# Altium schematic sheet MONO65_A2_s04 [Switches-1].SchDoc
size A3; DocumentNumber: 4; SheetNumber: 4; SheetTotal: 7
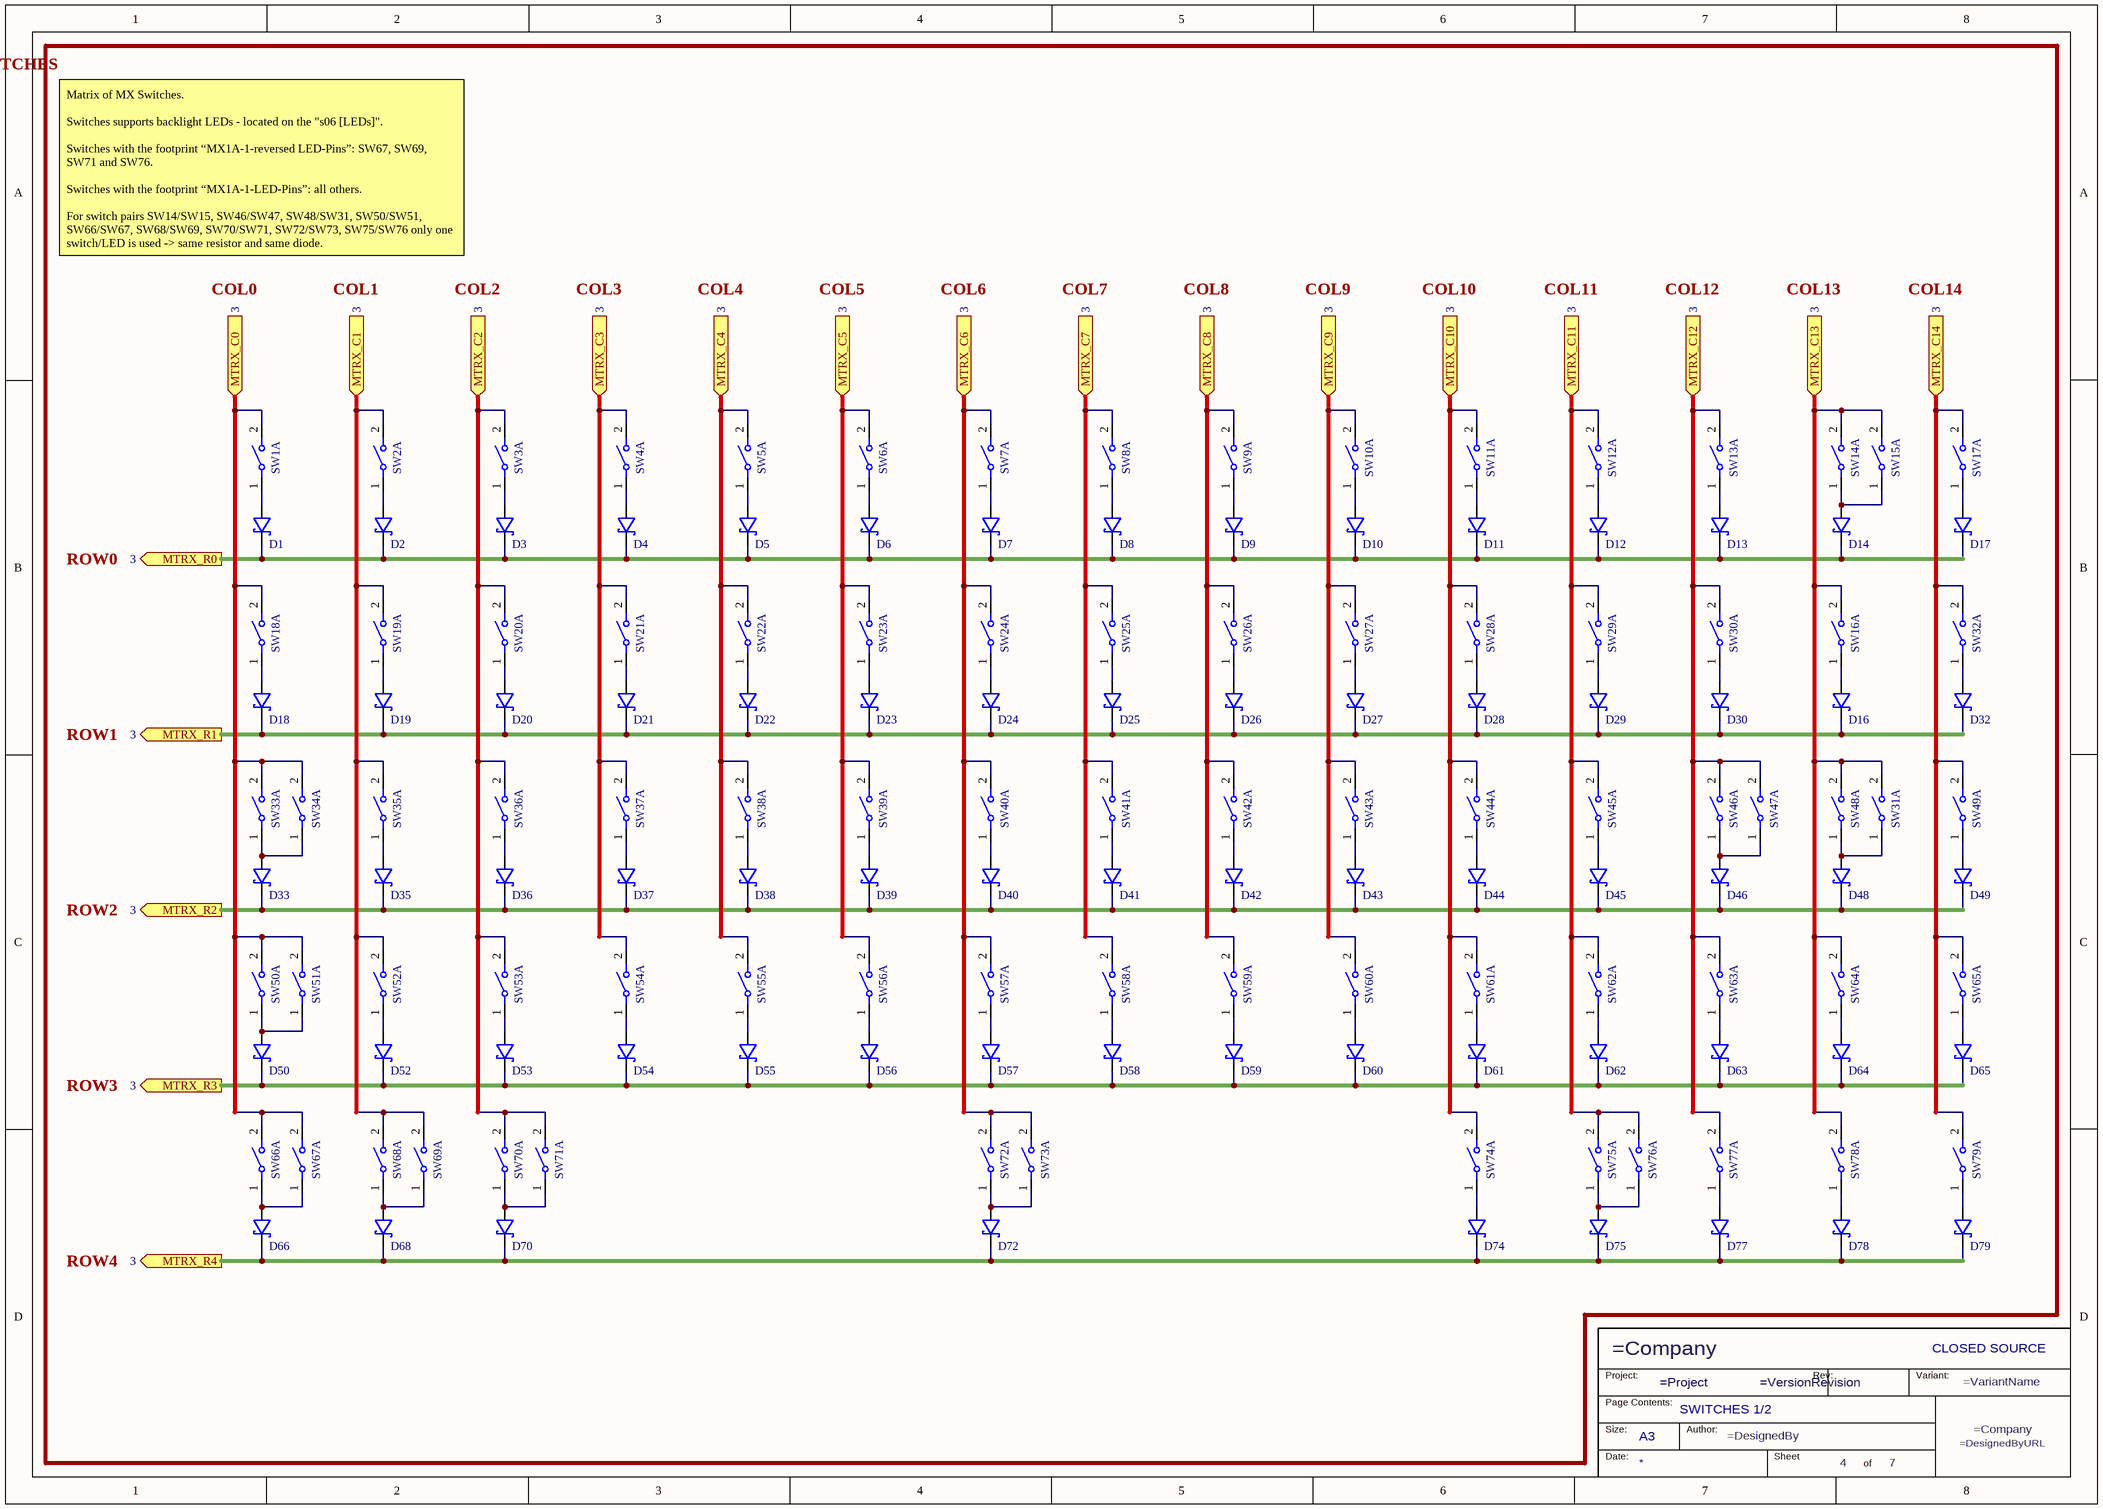
[diagram p0: MONO65_A2_s04 [Switches-1].SchDoc]

## Parts
D1  SD0805S040S0R5  [DIOC2012X06N - signal]  (value not drawn)
D2  SD0805S040S0R5  [DIOC2012X06N - signal]  (value not drawn)
D3  SD0805S040S0R5  [DIOC2012X06N - signal]  (value not drawn)
D4  SD0805S040S0R5  [DIOC2012X06N - signal]  (value not drawn)
D5  SD0805S040S0R5  [DIOC2012X06N - signal]  (value not drawn)
D6  SD0805S040S0R5  [DIOC2012X06N - signal]  (value not drawn)
D7  SD0805S040S0R5  [DIOC2012X06N - signal]  (value not drawn)
D8  SD0805S040S0R5  [DIOC2012X06N - signal]  (value not drawn)
D9  SD0805S040S0R5  [DIOC2012X06N - signal]  (value not drawn)
D10  SD0805S040S0R5  [DIOC2012X06N - signal]  (value not drawn)
D11  SD0805S040S0R5  [DIOC2012X06N - signal]  (value not drawn)
D12  SD0805S040S0R5  [DIOC2012X06N - signal]  (value not drawn)
D13  SD0805S040S0R5  [DIOC2012X06N - signal]  (value not drawn)
D14  SD0805S040S0R5  [DIOC2012X06N - signal]  (value not drawn)
D16  SD0805S040S0R5  [DIOC2012X06N - signal]  (value not drawn)
D17  SD0805S040S0R5  [DIOC2012X06N - signal]  (value not drawn)
D18  SD0805S040S0R5  [DIOC2012X06N - signal]  (value not drawn)
D19  SD0805S040S0R5  [DIOC2012X06N - signal]  (value not drawn)
D20  SD0805S040S0R5  [DIOC2012X06N - signal]  (value not drawn)
D21  SD0805S040S0R5  [DIOC2012X06N - signal]  (value not drawn)
D22  SD0805S040S0R5  [DIOC2012X06N - signal]  (value not drawn)
D23  SD0805S040S0R5  [DIOC2012X06N - signal]  (value not drawn)
D24  SD0805S040S0R5  [DIOC2012X06N - signal]  (value not drawn)
D25  SD0805S040S0R5  [DIOC2012X06N - signal]  (value not drawn)
D26  SD0805S040S0R5  [DIOC2012X06N - signal]  (value not drawn)
D27  SD0805S040S0R5  [DIOC2012X06N - signal]  (value not drawn)
D28  SD0805S040S0R5  [DIOC2012X06N - signal]  (value not drawn)
D29  SD0805S040S0R5  [DIOC2012X06N - signal]  (value not drawn)
D30  SD0805S040S0R5  [DIOC2012X06N - signal]  (value not drawn)
D32  SD0805S040S0R5  [DIOC2012X06N - signal]  (value not drawn)
D33  SD0805S040S0R5  [DIOC2012X06N - signal]  (value not drawn)
D35  SD0805S040S0R5  [DIOC2012X06N - signal]  (value not drawn)
D36  SD0805S040S0R5  [DIOC2012X06N - signal]  (value not drawn)
D37  SD0805S040S0R5  [DIOC2012X06N - signal]  (value not drawn)
D38  SD0805S040S0R5  [DIOC2012X06N - signal]  (value not drawn)
D39  SD0805S040S0R5  [DIOC2012X06N - signal]  (value not drawn)
D40  SD0805S040S0R5  [DIOC2012X06N - signal]  (value not drawn)
D41  SD0805S040S0R5  [DIOC2012X06N - signal]  (value not drawn)
D42  SD0805S040S0R5  [DIOC2012X06N - signal]  (value not drawn)
D43  SD0805S040S0R5  [DIOC2012X06N - signal]  (value not drawn)
D44  SD0805S040S0R5  [DIOC2012X06N - signal]  (value not drawn)
D45  SD0805S040S0R5  [DIOC2012X06N - signal]  (value not drawn)
D46  SD0805S040S0R5  [DIOC2012X06N - signal]  (value not drawn)
D48  SD0805S040S0R5  [DIOC2012X06N - signal]  (value not drawn)
D49  SD0805S040S0R5  [DIOC2012X06N - signal]  (value not drawn)
D50  SD0805S040S0R5  [DIOC2012X06N - signal]  (value not drawn)
D52  SD0805S040S0R5  [DIOC2012X06N - signal]  (value not drawn)
D53  SD0805S040S0R5  [DIOC2012X06N - signal]  (value not drawn)
D54  SD0805S040S0R5  [DIOC2012X06N - signal]  (value not drawn)
D55  SD0805S040S0R5  [DIOC2012X06N - signal]  (value not drawn)
D56  SD0805S040S0R5  [DIOC2012X06N - signal]  (value not drawn)
D57  SD0805S040S0R5  [DIOC2012X06N - signal]  (value not drawn)
D58  SD0805S040S0R5  [DIOC2012X06N - signal]  (value not drawn)
D59  SD0805S040S0R5  [DIOC2012X06N - signal]  (value not drawn)
D60  SD0805S040S0R5  [DIOC2012X06N - signal]  (value not drawn)
D61  SD0805S040S0R5  [DIOC2012X06N - signal]  (value not drawn)
D62  SD0805S040S0R5  [DIOC2012X06N - signal]  (value not drawn)
D63  SD0805S040S0R5  [DIOC2012X06N - signal]  (value not drawn)
D64  SD0805S040S0R5  [DIOC2012X06N - signal]  (value not drawn)
D65  SD0805S040S0R5  [DIOC2012X06N - signal]  (value not drawn)
D66  SD0805S040S0R5  [DIOC2012X06N - signal]  (value not drawn)
D68  SD0805S040S0R5  [DIOC2012X06N - signal]  (value not drawn)
D70  SD0805S040S0R5  [DIOC2012X06N - signal]  (value not drawn)
D72  SD0805S040S0R5  [DIOC2012X06N - signal]  (value not drawn)
D74  SD0805S040S0R5  [DIOC2012X06N - signal]  (value not drawn)
D75  SD0805S040S0R5  [DIOC2012X06N - signal]  (value not drawn)
D77  SD0805S040S0R5  [DIOC2012X06N - signal]  (value not drawn)
D78  SD0805S040S0R5  [DIOC2012X06N - signal]  (value not drawn)
D79  SD0805S040S0R5  [DIOC2012X06N - signal]  (value not drawn)
SW1  MX1A-11GW  [MX1A-1-LED-Pins]  (value not drawn)  (part A of 2)
SW2  MX1A-11GW  [MX1A-1-LED-Pins]  (value not drawn)  (part A of 2)
SW3  MX1A-11GW  [MX1A-1-LED-Pins]  (value not drawn)  (part A of 2)
SW4  MX1A-11GW  [MX1A-1-LED-Pins]  (value not drawn)  (part A of 2)
SW5  MX1A-11GW  [MX1A-1-LED-Pins]  (value not drawn)  (part A of 2)
SW6  MX1A-11GW  [MX1A-1-LED-Pins]  (value not drawn)  (part A of 2)
SW7  MX1A-11GW  [MX1A-1-LED-Pins]  (value not drawn)  (part A of 2)
SW8  MX1A-11GW  [MX1A-1-LED-Pins]  (value not drawn)  (part A of 2)
SW9  MX1A-11GW  [MX1A-1-LED-Pins]  (value not drawn)  (part A of 2)
SW10  MX1A-11GW  [MX1A-1-LED-Pins]  (value not drawn)  (part A of 2)
SW11  MX1A-11GW  [MX1A-1-LED-Pins]  (value not drawn)  (part A of 2)
SW12  MX1A-11GW  [MX1A-1-LED-Pins]  (value not drawn)  (part A of 2)
SW13  MX1A-11GW  [MX1A-1-LED-Pins]  (value not drawn)  (part A of 2)
SW14  MX1A-11GW  [MX1A-1-LED-Pins]  (value not drawn)  (part A of 2)
SW15  MX1A-11GW  [MX1A-1-LED-Pins]  (value not drawn)  (part A of 2)
SW16  MX1A-11GW  [MX1A-1-LED-Pins]  (value not drawn)  (part A of 2)
SW17  MX1A-11GW  [MX1A-1-LED-Pins]  (value not drawn)  (part A of 2)
SW18  MX1A-11GW  [MX1A-1-LED-Pins]  (value not drawn)  (part A of 2)
SW19  MX1A-11GW  [MX1A-1-LED-Pins]  (value not drawn)  (part A of 2)
SW20  MX1A-11GW  [MX1A-1-LED-Pins]  (value not drawn)  (part A of 2)
SW21  MX1A-11GW  [MX1A-1-LED-Pins]  (value not drawn)  (part A of 2)
SW22  MX1A-11GW  [MX1A-1-LED-Pins]  (value not drawn)  (part A of 2)
SW23  MX1A-11GW  [MX1A-1-LED-Pins]  (value not drawn)  (part A of 2)
SW24  MX1A-11GW  [MX1A-1-LED-Pins]  (value not drawn)  (part A of 2)
SW25  MX1A-11GW  [MX1A-1-LED-Pins]  (value not drawn)  (part A of 2)
SW26  MX1A-11GW  [MX1A-1-LED-Pins]  (value not drawn)  (part A of 2)
SW27  MX1A-11GW  [MX1A-1-LED-Pins]  (value not drawn)  (part A of 2)
SW28  MX1A-11GW  [MX1A-1-LED-Pins]  (value not drawn)  (part A of 2)
SW29  MX1A-11GW  [MX1A-1-LED-Pins]  (value not drawn)  (part A of 2)
SW30  MX1A-11GW  [MX1A-1-LED-Pins]  (value not drawn)  (part A of 2)
SW31  MX1A-11GW  [MX1A-1-LED-Pins]  (value not drawn)  (part A of 2)
SW32  MX1A-11GW  [MX1A-1-LED-Pins]  (value not drawn)  (part A of 2)
SW33  MX1A-11GW  [MX1A-1-LED-Pins]  (value not drawn)  (part A of 2)
SW34  MX1A-11GW  [MX1A-1-LED-Pins]  (value not drawn)  (part A of 2)
SW35  MX1A-11GW  [MX1A-1-LED-Pins]  (value not drawn)  (part A of 2)
SW36  MX1A-11GW  [MX1A-1-LED-Pins]  (value not drawn)  (part A of 2)
SW37  MX1A-11GW  [MX1A-1-LED-Pins]  (value not drawn)  (part A of 2)
SW38  MX1A-11GW  [MX1A-1-LED-Pins]  (value not drawn)  (part A of 2)
SW39  MX1A-11GW  [MX1A-1-LED-Pins]  (value not drawn)  (part A of 2)
SW40  MX1A-11GW  [MX1A-1-LED-Pins]  (value not drawn)  (part A of 2)
SW41  MX1A-11GW  [MX1A-1-LED-Pins]  (value not drawn)  (part A of 2)
SW42  MX1A-11GW  [MX1A-1-LED-Pins]  (value not drawn)  (part A of 2)
SW43  MX1A-11GW  [MX1A-1-LED-Pins]  (value not drawn)  (part A of 2)
SW44  MX1A-11GW  [MX1A-1-LED-Pins]  (value not drawn)  (part A of 2)
SW45  MX1A-11GW  [MX1A-1-LED-Pins]  (value not drawn)  (part A of 2)
SW46  MX1A-11GW  [MX1A-1-LED-Pins]  (value not drawn)  (part A of 2)
SW47  MX1A-11GW  [MX1A-1-LED-Pins]  (value not drawn)  (part A of 2)
SW48  MX1A-11GW  [MX1A-1-LED-Pins]  (value not drawn)  (part A of 2)
SW49  MX1A-11GW  [MX1A-1-LED-Pins]  (value not drawn)  (part A of 2)
SW50  MX1A-11GW  [MX1A-1-LED-Pins]  (value not drawn)  (part A of 2)
SW51  MX1A-11GW  [MX1A-1-LED-Pins]  (value not drawn)  (part A of 2)
SW52  MX1A-11GW  [MX1A-1-LED-Pins]  (value not drawn)  (part A of 2)
SW53  MX1A-11GW  [MX1A-1-LED-Pins]  (value not drawn)  (part A of 2)
SW54  MX1A-11GW  [MX1A-1-LED-Pins]  (value not drawn)  (part A of 2)
SW55  MX1A-11GW  [MX1A-1-LED-Pins]  (value not drawn)  (part A of 2)
SW56  MX1A-11GW  [MX1A-1-LED-Pins]  (value not drawn)  (part A of 2)
SW57  MX1A-11GW  [MX1A-1-LED-Pins]  (value not drawn)  (part A of 2)
SW58  MX1A-11GW  [MX1A-1-LED-Pins]  (value not drawn)  (part A of 2)
SW59  MX1A-11GW  [MX1A-1-LED-Pins]  (value not drawn)  (part A of 2)
SW60  MX1A-11GW  [MX1A-1-LED-Pins]  (value not drawn)  (part A of 2)
SW61  MX1A-11GW  [MX1A-1-LED-Pins]  (value not drawn)  (part A of 2)
SW62  MX1A-11GW  [MX1A-1-LED-Pins]  (value not drawn)  (part A of 2)
SW63  MX1A-11GW  [MX1A-1-LED-Pins]  (value not drawn)  (part A of 2)
SW64  MX1A-11GW  [MX1A-1-LED-Pins]  (value not drawn)  (part A of 2)
SW65  MX1A-11GW  [MX1A-1-LED-Pins]  (value not drawn)  (part A of 2)
SW66  MX1A-11GW  [MX1A-1-LED-Pins]  (value not drawn)  (part A of 2)
SW67  MX1A-11GW  [MX1A-1-reversed LED-Pins]  (value not drawn)  (part A of 2)
SW68  MX1A-11GW  [MX1A-1-LED-Pins]  (value not drawn)  (part A of 2)
SW69  MX1A-11GW  [MX1A-1-reversed LED-Pins]  (value not drawn)  (part A of 2)
SW70  MX1A-11GW  [MX1A-1-LED-Pins]  (value not drawn)  (part A of 2)
SW71  MX1A-11GW  [MX1A-1-reversed LED-Pins]  (value not drawn)  (part A of 2)
SW72  MX1A-11GW  [MX1A-1-LED-Pins]  (value not drawn)  (part A of 2)
SW73  MX1A-11GW  [MX1A-1-LED-Pins]  (value not drawn)  (part A of 2)
SW74  MX1A-11GW  [MX1A-1-LED-Pins]  (value not drawn)  (part A of 2)
SW75  MX1A-11GW  [MX1A-1-LED-Pins]  (value not drawn)  (part A of 2)
SW76  MX1A-11GW  [MX1A-1-reversed LED-Pins]  (value not drawn)  (part A of 2)
SW77  MX1A-11GW  [MX1A-1-LED-Pins]  (value not drawn)  (part A of 2)
SW78  MX1A-11GW  [MX1A-1-LED-Pins]  (value not drawn)  (part A of 2)
SW79  MX1A-11GW  [MX1A-1-LED-Pins]  (value not drawn)  (part A of 2)
TB*?  PageContents: SWITCHES 1/2  Licence: CLOSED SOURCE  Size: A3  (hidden comment: TBL TitleBlock 01)  (graphical)

## Ports
MTRX_C0 (in, see 3), MTRX_C1 (in, see 3), MTRX_C2 (in, see 3), MTRX_C3 (in, see 3), MTRX_C4 (in, see 3), MTRX_C5 (in, see 3), MTRX_C6 (in, see 3), MTRX_C7 (in, see 3), MTRX_C8 (in, see 3), MTRX_C9 (in, see 3), MTRX_C10 (in, see 3), MTRX_C11 (in, see 3), MTRX_C12 (in, see 3), MTRX_C13 (in, see 3), MTRX_C14 (in, see 3), MTRX_R0 (out, see 3), MTRX_R1 (out, see 3), MTRX_R2 (out, see 3), MTRX_R3 (out, see 3), MTRX_R4 (out, see 3)

## Nets
MTRX_C0: SW1.2(N.O.) SW18.2(N.O.) SW33.2(N.O.) SW34.2(N.O.) SW50.2(N.O.) SW51.2(N.O.) SW66.2(N.O.) SW67.2(N.O.) ; port MTRX_C0
MTRX_C1: SW2.2(N.O.) SW19.2(N.O.) SW35.2(N.O.) SW52.2(N.O.) SW68.2(N.O.) SW69.2(N.O.) ; port MTRX_C1
MTRX_C2: SW3.2(N.O.) SW20.2(N.O.) SW36.2(N.O.) SW53.2(N.O.) SW70.2(N.O.) SW71.2(N.O.) ; port MTRX_C2
MTRX_C3: SW4.2(N.O.) SW21.2(N.O.) SW37.2(N.O.) SW54.2(N.O.) ; port MTRX_C3
MTRX_C4: SW5.2(N.O.) SW22.2(N.O.) SW38.2(N.O.) SW55.2(N.O.) ; port MTRX_C4
MTRX_C5: SW6.2(N.O.) SW23.2(N.O.) SW39.2(N.O.) SW56.2(N.O.) ; port MTRX_C5
MTRX_C6: SW7.2(N.O.) SW24.2(N.O.) SW40.2(N.O.) SW57.2(N.O.) SW72.2(N.O.) SW73.2(N.O.) ; port MTRX_C6
MTRX_C7: SW8.2(N.O.) SW25.2(N.O.) SW41.2(N.O.) SW58.2(N.O.) ; port MTRX_C7
MTRX_C8: SW9.2(N.O.) SW26.2(N.O.) SW42.2(N.O.) SW59.2(N.O.) ; port MTRX_C8
MTRX_C9: SW10.2(N.O.) SW27.2(N.O.) SW43.2(N.O.) SW60.2(N.O.) ; port MTRX_C9
MTRX_C10: SW11.2(N.O.) SW28.2(N.O.) SW44.2(N.O.) SW61.2(N.O.) SW74.2(N.O.) ; port MTRX_C10
MTRX_C11: SW12.2(N.O.) SW29.2(N.O.) SW45.2(N.O.) SW62.2(N.O.) SW75.2(N.O.) SW76.2(N.O.) ; port MTRX_C11
MTRX_C12: SW13.2(N.O.) SW30.2(N.O.) SW46.2(N.O.) SW47.2(N.O.) SW63.2(N.O.) SW77.2(N.O.) ; port MTRX_C12
MTRX_C13: SW14.2(N.O.) SW15.2(N.O.) SW16.2(N.O.) SW31.2(N.O.) SW48.2(N.O.) SW64.2(N.O.) SW78.2(N.O.) ; port MTRX_C13
MTRX_C14: SW17.2(N.O.) SW32.2(N.O.) SW49.2(N.O.) SW65.2(N.O.) SW79.2(N.O.) ; port MTRX_C14
MTRX_R0: D1.1(K) D2.1(K) D3.1(K) D4.1(K) D5.1(K) D6.1(K) D7.1(K) D8.1(K) D9.1(K) D10.1(K) D11.1(K) D12.1(K) D13.1(K) D14.1(K) D17.1(K) ; port MTRX_R0
MTRX_R1: D16.1(K) D18.1(K) D19.1(K) D20.1(K) D21.1(K) D22.1(K) D23.1(K) D24.1(K) D25.1(K) D26.1(K) D27.1(K) D28.1(K) D29.1(K) D30.1(K) D32.1(K) ; port MTRX_R1
MTRX_R2: D33.1(K) D35.1(K) D36.1(K) D37.1(K) D38.1(K) D39.1(K) D40.1(K) D41.1(K) D42.1(K) D43.1(K) D44.1(K) D45.1(K) D46.1(K) D48.1(K) D49.1(K) ; port MTRX_R2
MTRX_R3: D50.1(K) D52.1(K) D53.1(K) D54.1(K) D55.1(K) D56.1(K) D57.1(K) D58.1(K) D59.1(K) D60.1(K) D61.1(K) D62.1(K) D63.1(K) D64.1(K) D65.1(K) ; port MTRX_R3
MTRX_R4: D66.1(K) D68.1(K) D70.1(K) D72.1(K) D74.1(K) D75.1(K) D77.1(K) D78.1(K) D79.1(K) ; port MTRX_R4
NetD1_2: D1.2(A) SW1.1(COM)
NetD2_2: D2.2(A) SW2.1(COM)
NetD3_2: D3.2(A) SW3.1(COM)
NetD4_2: D4.2(A) SW4.1(COM)
NetD5_2: D5.2(A) SW5.1(COM)
NetD6_2: D6.2(A) SW6.1(COM)
NetD7_2: D7.2(A) SW7.1(COM)
NetD8_2: D8.2(A) SW8.1(COM)
NetD9_2: D9.2(A) SW9.1(COM)
NetD10_2: D10.2(A) SW10.1(COM)
NetD11_2: D11.2(A) SW11.1(COM)
NetD12_2: D12.2(A) SW12.1(COM)
NetD13_2: D13.2(A) SW13.1(COM)
NetD14_2: D14.2(A) SW14.1(COM) SW15.1(COM)
NetD16_2: D16.2(A) SW16.1(COM)
NetD17_2: D17.2(A) SW17.1(COM)
NetD18_2: D18.2(A) SW18.1(COM)
NetD19_2: D19.2(A) SW19.1(COM)
NetD20_2: D20.2(A) SW20.1(COM)
NetD21_2: D21.2(A) SW21.1(COM)
NetD22_2: D22.2(A) SW22.1(COM)
NetD23_2: D23.2(A) SW23.1(COM)
NetD24_2: D24.2(A) SW24.1(COM)
NetD25_2: D25.2(A) SW25.1(COM)
NetD26_2: D26.2(A) SW26.1(COM)
NetD27_2: D27.2(A) SW27.1(COM)
NetD28_2: D28.2(A) SW28.1(COM)
NetD29_2: D29.2(A) SW29.1(COM)
NetD30_2: D30.2(A) SW30.1(COM)
NetD32_2: D32.2(A) SW32.1(COM)
NetD33_2: D33.2(A) SW33.1(COM) SW34.1(COM)
NetD35_2: D35.2(A) SW35.1(COM)
NetD36_2: D36.2(A) SW36.1(COM)
NetD37_2: D37.2(A) SW37.1(COM)
NetD38_2: D38.2(A) SW38.1(COM)
NetD39_2: D39.2(A) SW39.1(COM)
NetD40_2: D40.2(A) SW40.1(COM)
NetD41_2: D41.2(A) SW41.1(COM)
NetD42_2: D42.2(A) SW42.1(COM)
NetD43_2: D43.2(A) SW43.1(COM)
NetD44_2: D44.2(A) SW44.1(COM)
NetD45_2: D45.2(A) SW45.1(COM)
NetD46_2: D46.2(A) SW46.1(COM) SW47.1(COM)
NetD48_2: D48.2(A) SW31.1(COM) SW48.1(COM)
NetD49_2: D49.2(A) SW49.1(COM)
NetD50_2: D50.2(A) SW50.1(COM) SW51.1(COM)
NetD52_2: D52.2(A) SW52.1(COM)
NetD53_2: D53.2(A) SW53.1(COM)
NetD54_2: D54.2(A) SW54.1(COM)
NetD55_2: D55.2(A) SW55.1(COM)
NetD56_2: D56.2(A) SW56.1(COM)
NetD57_2: D57.2(A) SW57.1(COM)
NetD58_2: D58.2(A) SW58.1(COM)
NetD59_2: D59.2(A) SW59.1(COM)
NetD60_2: D60.2(A) SW60.1(COM)
NetD61_2: D61.2(A) SW61.1(COM)
NetD62_2: D62.2(A) SW62.1(COM)
NetD63_2: D63.2(A) SW63.1(COM)
NetD64_2: D64.2(A) SW64.1(COM)
NetD65_2: D65.2(A) SW65.1(COM)
NetD66_2: D66.2(A) SW66.1(COM) SW67.1(COM)
NetD68_2: D68.2(A) SW68.1(COM) SW69.1(COM)
NetD70_2: D70.2(A) SW70.1(COM) SW71.1(COM)
NetD72_2: D72.2(A) SW72.1(COM) SW73.1(COM)
NetD74_2: D74.2(A) SW74.1(COM)
NetD75_2: D75.2(A) SW75.1(COM) SW76.1(COM)
NetD77_2: D77.2(A) SW77.1(COM)
NetD78_2: D78.2(A) SW78.1(COM)
NetD79_2: D79.2(A) SW79.1(COM)

## Notes on the sheet
- MX SWITCHES
- Matrix of MX Switches.
  Switches supports backlight LEDs - located on the "s06 [LEDs]".
  Switches with the footprint “MX1A-1-reversed LED-Pins”: SW67, SW69, SW71 and SW76.
  Switches with the footprint “MX1A-1-LED-Pins”: all others.
  For switch pairs SW14/SW15, SW46/SW47, SW48/SW31, SW50/SW51, SW66/SW67, SW68/SW69, SW70/SW71, SW72/SW73, SW75/SW76 only one switch/LED is used -> same resistor and same diode.
- COL0
- COL1
- COL2
- COL3
- COL4
- COL5
- COL6
- COL7
- COL8
- COL9
- COL10
- COL11
- COL12
- COL13
- COL14
- ROW0
- ROW1
- ROW2
- ROW3
- ROW4
- (in symbol TBL TitleBlock 01) Project:; Rev:; Variant:; Page Contents:; Size:; Author:; Date:; Sheet; of

## Library data of the parts
D1-D14 D16-D30 D32 D33 D35-D46 D48-D50 D52-D66 D68 D70 D72 D74 D75 D77-D79 = SEM SCH 40V 0.5A 0805 SD0805S040S0R5: Schottky Diode, Small Signal, Single, 40 V, 500 mA, 480 mV, 5A max.; Manufacturer: Kyocera AVX; Forward Current: 500mA; Max Reverse Current: 100uA; Forward Voltage: 480mV; Max Repetitive Reverse Voltage (Vrrm): 40V; Supplier 1: Digi-Key; Manufacturer Part Number: SD0805S040S0R5; Stock 1: 50780; Pricing 1: 1 = 0,47000, 10 = 0,35600, 100 = 0,22150, 500 = 0,15158, 1000 = 0,11660 (USD); RoHS: Yes; Mount: Surface Mount; Number of Pins: 2; Case Code (Metric): 2012; Case Code (Imperial): 0805; Min Operating Temperature: -55°C; Max Operating Temperature: 125°C; Max Surge Current: 5A; Packaging: Tape and Reel; Package Quantity: 3000; Average Rectified Current: 500mA; Max Reverse Leakage Current: 100uA; Peak Non-Repetitive Surge Current: 5A; Max Forward Surge Current (Ifsm): 5A; Element Configuration: Single; Max Reverse Voltage (DC): 40V; Series: -; Radiation Hardening: No; REACH SVHC: No SVHC; RoHS Compliant: Yes; ComponentLink1URL: https://datasheet.ciiva.com/46411/1796790-46411381.pdf?src-supplier=Element14; ComponentLink1Description: https://datasheet.ciiva.com/46411/1796790-46411381.pdf?src-supplier=Element14; ComponentLink2URL: https://datasheet.ciiva.com/6377/schottky-6377002.pdf?src-supplier=Digi-Key; ComponentLink2Description: https://datasheet.ciiva.com/6377/schottky-6377002.pdf?src-supplier=Digi-Key; ComponentLink3URL: https://datasheet.ciiva.com/6377/schottky-6377003.pdf?src-supplier=Digi-Key; ComponentLink3Description: https://datasheet.ciiva.com/6377/schottky-6377003.pdf?src-supplier=Digi-Key; Supplier Part Number 1: 478-7802-1-ND; Case/Package: 0805
SW1-SW79 = SW MX1A-11GW: Cherry MX switch, 1-pole w/LED, w/fixation pins, GREEN LED; Supplier 1: Digi-Key; Manufacturer: Cherry; Manufacturer Part Number: MX1A-11GW; Stock 1: 0; Pricing 1: 8000 = 1,62196 (USD); RoHS: No; Supplier Part Number 1: MX1A-11GW-ND
TB*? = TBL TitleBlock 01: Custom Title block